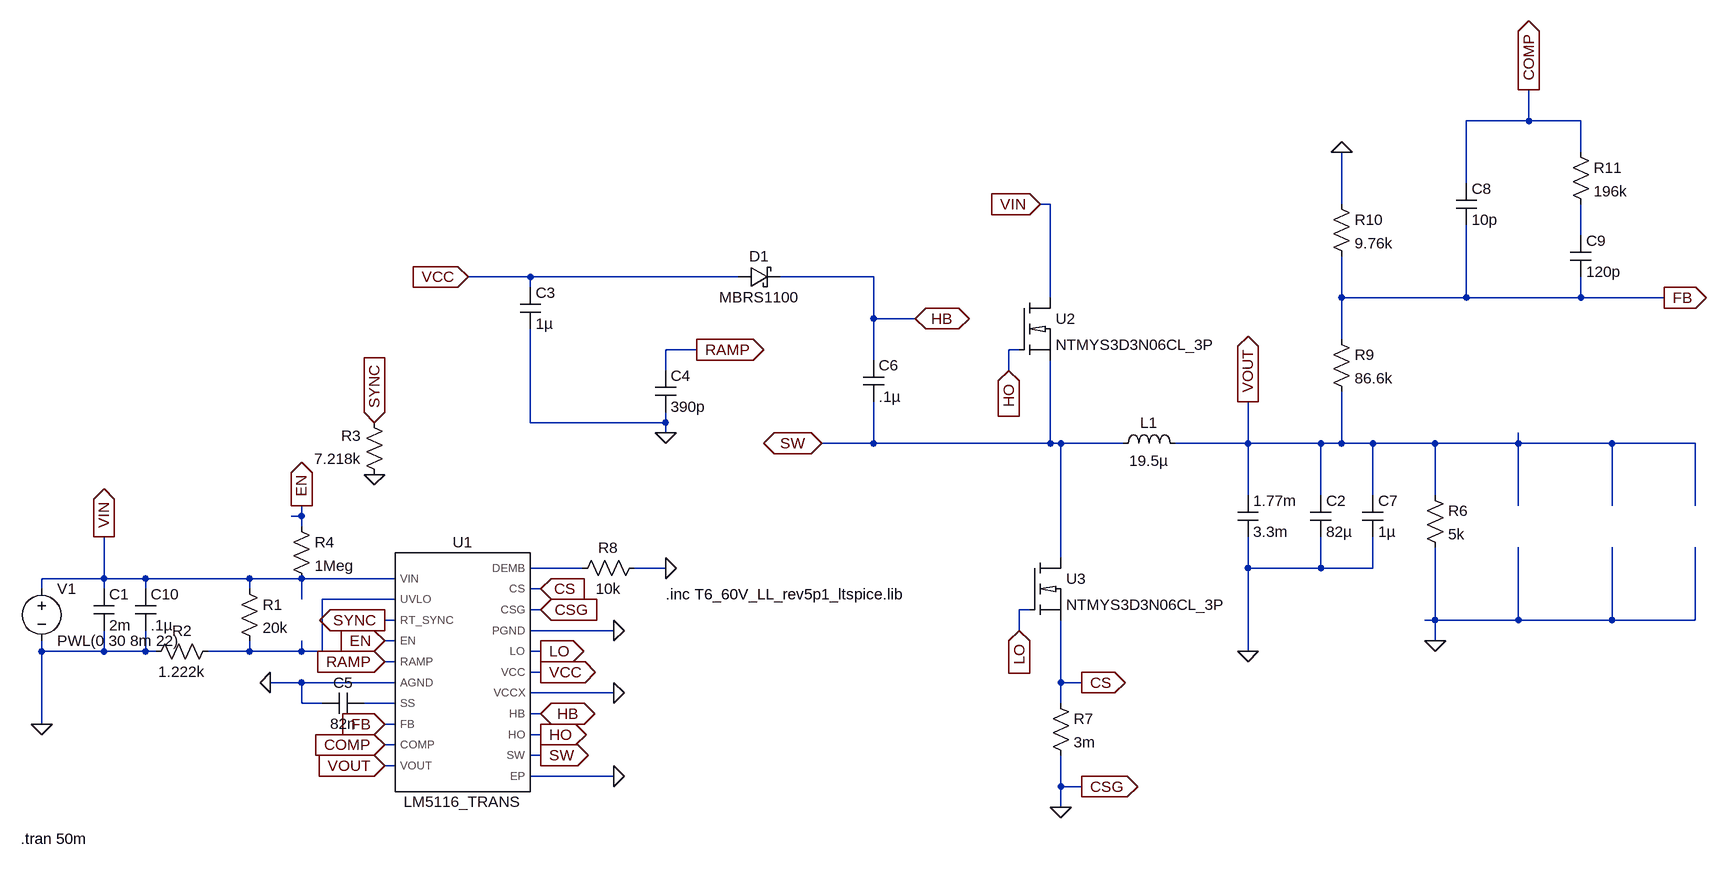
[diagram p0: schematic lm5116buck.asc]
lm5116buck.asc, the LTspice schematic file:
Version 4.1
SHEET 1 2216 680
WIRE 1904 -800 1904 -848
WIRE 1904 -800 1808 -800
WIRE 1984 -800 1904 -800
WIRE 1984 -752 1984 -800
WIRE 1808 -704 1808 -800
WIRE 1168 -672 1152 -672
WIRE 1616 -672 1616 -752
WIRE 1984 -624 1984 -672
WIRE 368 -560 272 -560
WIRE 688 -560 368 -560
WIRE 896 -560 752 -560
WIRE 368 -544 368 -560
WIRE 1168 -528 1168 -672
WIRE 1616 -528 1616 -592
WIRE 1808 -528 1808 -640
WIRE 1808 -528 1616 -528
WIRE 1984 -528 1984 -560
WIRE 1984 -528 1808 -528
WIRE 2112 -528 1984 -528
WIRE 896 -496 896 -560
WIRE 960 -496 896 -496
WIRE 1616 -464 1616 -528
WIRE 624 -448 576 -448
WIRE 1120 -448 1104 -448
WIRE 896 -432 896 -496
WIRE 576 -416 576 -448
WIRE 1104 -416 1104 -448
WIRE 368 -336 368 -480
WIRE 576 -336 576 -352
WIRE 576 -336 368 -336
WIRE 576 -320 576 -336
WIRE 896 -304 896 -368
WIRE 896 -304 816 -304
WIRE 1168 -304 1168 -432
WIRE 1168 -304 896 -304
WIRE 1184 -304 1168 -304
WIRE 1280 -304 1184 -304
WIRE 1472 -304 1472 -368
WIRE 1472 -304 1360 -304
WIRE 1584 -304 1472 -304
WIRE 1616 -304 1616 -384
WIRE 1616 -304 1584 -304
WIRE 1664 -304 1616 -304
WIRE 1760 -304 1664 -304
WIRE 1888 -304 1888 -320
WIRE 1888 -304 1760 -304
WIRE 2032 -304 1888 -304
WIRE 2160 -304 2032 -304
WIRE 1472 -224 1472 -304
WIRE 1584 -224 1584 -304
WIRE 1664 -224 1664 -304
WIRE 1760 -224 1760 -304
WIRE 1888 -208 1888 -304
WIRE 2032 -208 2032 -304
WIRE 2160 -208 2160 -304
WIRE 16 -192 16 -208
WIRE 16 -192 0 -192
WIRE 16 -176 16 -192
WIRE 1184 -128 1184 -304
WIRE 448 -112 368 -112
WIRE 576 -112 528 -112
WIRE 1472 -112 1472 -160
WIRE 1584 -112 1584 -160
WIRE 1584 -112 1472 -112
WIRE 1664 -112 1664 -160
WIRE 1664 -112 1584 -112
WIRE -288 -96 -288 -160
WIRE -288 -96 -384 -96
WIRE -224 -96 -288 -96
WIRE -64 -96 -224 -96
WIRE 16 -96 -64 -96
WIRE 160 -96 16 -96
WIRE -384 -80 -384 -96
WIRE -288 -80 -288 -96
WIRE -224 -80 -224 -96
WIRE -64 -80 -64 -96
WIRE 384 -80 368 -80
WIRE 16 -64 16 -96
WIRE 160 -64 48 -64
WIRE 384 -48 368 -48
WIRE 1136 -48 1120 -48
WIRE 160 -32 144 -32
WIRE 1760 -32 1760 -144
WIRE 1760 -32 1744 -32
WIRE 1888 -32 1888 -144
WIRE 1888 -32 1760 -32
WIRE 2032 -32 2032 -144
WIRE 2032 -32 1888 -32
WIRE 2160 -32 2160 -144
WIRE 2160 -32 2032 -32
WIRE 496 -16 368 -16
WIRE 1120 -16 1120 -48
WIRE 160 0 144 0
WIRE 1760 0 1760 -32
WIRE -384 16 -384 0
WIRE -288 16 -288 -16
WIRE -288 16 -384 16
WIRE -224 16 -224 -16
WIRE -224 16 -288 16
WIRE -208 16 -224 16
WIRE -64 16 -64 0
WIRE -64 16 -128 16
WIRE 16 16 16 0
WIRE 16 16 -64 16
WIRE 48 16 48 -64
WIRE 48 16 16 16
WIRE 384 16 368 16
WIRE 1472 16 1472 -112
WIRE 160 32 144 32
WIRE 384 48 368 48
WIRE 16 64 -32 64
WIRE 160 64 16 64
WIRE 1184 64 1184 -32
WIRE 1216 64 1184 64
WIRE 496 80 368 80
WIRE 16 96 16 64
WIRE 48 96 16 96
WIRE 160 96 112 96
WIRE 1184 96 1184 64
WIRE 384 112 368 112
WIRE -384 128 -384 16
WIRE 160 128 144 128
WIRE 384 144 368 144
WIRE 160 160 144 160
WIRE 384 176 368 176
WIRE 160 192 144 192
WIRE 496 208 368 208
WIRE 1184 224 1184 176
WIRE 1216 224 1184 224
WIRE 1184 256 1184 224
FLAG -384 128 0
FLAG 128 -256 0
FLAG 144 0 EN
IOPIN 144 0 In
FLAG 16 -208 EN
IOPIN 16 -208 Out
FLAG 128 -336 SYNC
IOPIN 128 -336 In
FLAG 144 -32 SYNC
IOPIN 144 -32 Out
FLAG 384 48 VCC
IOPIN 384 48 Out
FLAG 272 -560 VCC
IOPIN 272 -560 In
FLAG 576 -320 0
FLAG 624 -448 RAMP
IOPIN 624 -448 Out
FLAG 144 32 RAMP
IOPIN 144 32 In
FLAG -32 64 0
FLAG 960 -496 HB
IOPIN 960 -496 BiDir
FLAG 384 112 HB
IOPIN 384 112 BiDir
FLAG 816 -304 SW
IOPIN 816 -304 BiDir
FLAG 384 176 SW
IOPIN 384 176 Out
FLAG -288 -160 VIN
IOPIN -288 -160 Out
FLAG 1152 -672 VIN
IOPIN 1152 -672 In
FLAG 1472 16 0
FLAG 1104 -416 HO
IOPIN 1104 -416 In
FLAG 384 144 HO
IOPIN 384 144 Out
FLAG 1760 0 0
FLAG 1184 256 0
FLAG 1120 -16 LO
IOPIN 1120 -16 In
FLAG 384 16 LO
IOPIN 384 16 Out
FLAG 1216 64 CS
IOPIN 1216 64 Out
FLAG 384 -80 CS
IOPIN 384 -80 In
FLAG 1216 224 CSG
IOPIN 1216 224 Out
FLAG 384 -48 CSG
IOPIN 384 -48 In
FLAG 576 -112 0
FLAG 496 -16 0
FLAG 496 208 0
FLAG 1616 -752 0
FLAG 1904 -848 COMP
IOPIN 1904 -848 Out
FLAG 144 160 COMP
IOPIN 144 160 In
FLAG 144 128 FB
IOPIN 144 128 In
FLAG 2112 -528 FB
IOPIN 2112 -528 Out
FLAG 1472 -368 VOUT
IOPIN 1472 -368 Out
FLAG 144 192 VOUT
IOPIN 144 192 In
FLAG 496 80 0
SYMBOL voltage -384 -96 R0
WINDOW 123 0 0 Left 0
WINDOW 39 0 0 Left 0
SYMATTR InstName V1
SYMATTR Value PWL(0 30 8m 22)
SYMBOL cap -304 -80 R0
SYMATTR InstName C1
SYMATTR Value 2m
SYMATTR SpiceLine Rser=2m
SYMBOL res -80 -96 R0
SYMATTR InstName R1
SYMATTR Value 20k
SYMBOL res -112 0 R90
WINDOW 0 0 56 VBottom 2
WINDOW 3 32 56 VTop 2
SYMATTR InstName R2
SYMATTR Value 1.222k
SYMBOL res 144 -240 R180
WINDOW 0 36 76 Left 2
WINDOW 3 36 40 Left 2
SYMATTR InstName R3
SYMATTR Value 7.218k
SYMBOL cap 352 -544 R0
SYMATTR InstName C3
SYMATTR Value 1µ
SYMBOL cap 560 -416 R0
SYMATTR InstName C4
SYMATTR Value 390p
SYMBOL schottky 688 -544 R270
WINDOW 0 32 32 VTop 2
WINDOW 3 0 32 VBottom 2
SYMATTR InstName D1
SYMATTR Value MBRS1100
SYMATTR Description Diode
SYMATTR Type diode
SYMBOL cap 112 80 R90
WINDOW 0 0 32 VBottom 2
WINDOW 3 32 32 VTop 2
SYMATTR InstName C5
SYMATTR Value 82n
SYMBOL cap 880 -432 R0
SYMATTR InstName C6
SYMATTR Value .1µ
SYMBOL ind 1264 -288 R270
WINDOW 0 32 56 VTop 2
WINDOW 3 5 56 VBottom 2
SYMATTR InstName L1
SYMATTR Value 19.5µ
SYMATTR SpiceLine Rser=5.5m
SYMBOL cap 1456 -224 R0
SYMATTR InstName 1.77m
SYMATTR Value 3.3m
SYMATTR SpiceLine Rser=2m
SYMBOL res 1744 -240 R0
SYMATTR InstName R6
SYMATTR Value 5k
SYMBOL res 1168 80 R0
SYMATTR InstName R7
SYMATTR Value 3m
SYMBOL res 544 -128 R90
WINDOW 0 0 56 VBottom 2
WINDOW 3 32 56 VTop 2
SYMATTR InstName R8
SYMATTR Value 10k
SYMBOL res 1600 -480 R0
SYMATTR InstName R9
SYMATTR Value 86.6k
SYMBOL res 1600 -688 R0
SYMATTR InstName R10
SYMATTR Value 9.76k
SYMBOL cap 1792 -704 R0
SYMATTR InstName C8
SYMATTR Value 10p
SYMBOL cap 1968 -624 R0
SYMATTR InstName C9
SYMATTR Value 120p
SYMBOL res 1968 -768 R0
SYMATTR InstName R11
SYMATTR Value 196k
SYMBOL symbols\\LM5116_TRANS 256 48 R0
SYMATTR InstName U1
SYMBOL symbols\\NTMYS3D3N06CL_3P 1120 -528 R0
SYMATTR InstName U2
SYMBOL symbols\\NTMYS3D3N06CL_3P 1136 -128 R0
SYMATTR InstName U3
SYMBOL cap 1568 -224 R0
SYMATTR InstName C2
SYMATTR Value 82µ
SYMATTR SpiceLine Rser=3m
SYMBOL cap 1648 -224 R0
SYMATTR InstName C7
SYMATTR Value 1µ
SYMBOL cap -240 -80 R0
SYMATTR InstName C10
SYMATTR Value .1µ
SYMBOL res 0 -192 R0
SYMATTR InstName R4
SYMATTR Value 1Meg
TEXT -416 304 Left 2 !.tran 50m
TEXT 576 -72 Left 2 !.inc T6_60V_LL_rev5p1_ltspice.lib

The netlist it stands for:
* lm5116buck.asc
V1 VIN 0 PWL(0 30 8m 22)
C1 VIN 0 2m Rser=2m
R1 VIN N003 20k
R2 N003 0 1.222k
R3 0 SYNC 7.218k
C3 VCC 0 1µ
C4 RAMP 0 390p
D1 VCC HB MBRS1100
C5 N004 0 82n
C6 HB SW .1µ
L1 SW VOUT 19.5µ Rser=5.5m
C§1.77m VOUT 0 3.3m Rser=2m
R6 VOUT 0 5k
R7 CS 0 3m
R8 0 N002 10k
R9 FB VOUT 86.6k
R10 0 FB 9.76k
C8 COMP FB 10p
C9 N001 FB 120p
R11 COMP N001 196k
X§U1 VIN N003 SYNC EN RAMP 0 N004 FB COMP VOUT N002 CS 0 0 LO VCC 0 HB HO SW 0 LM5116_TRANS  ; pins VIN UVLO RT_SYNC EN RAMP AGND SS FB COMP VOUT DEMB CS CSG PGND LO VCC VCCX HB HO SW EP
X§U2 VIN HO SW NTMYS3D3N06CL_3P  ; pins D G S
X§U3 SW LO CS NTMYS3D3N06CL_3P  ; pins D G S
C2 VOUT 0 82µ Rser=3m
C7 VOUT 0 1µ
C10 VIN 0 .1µ
R4 EN VIN 1Meg
.model D D
.lib standard.dio
.tran 50m
.inc T6_60V_LL_rev5p1_ltspice.lib
.lib LM5116_TRANS.LIB
.backanno
.end